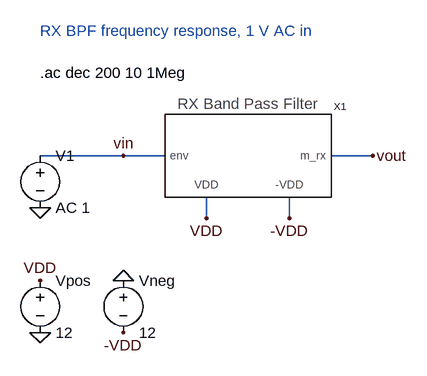
[diagram p0: schematic RX_BPF_AC.asc]
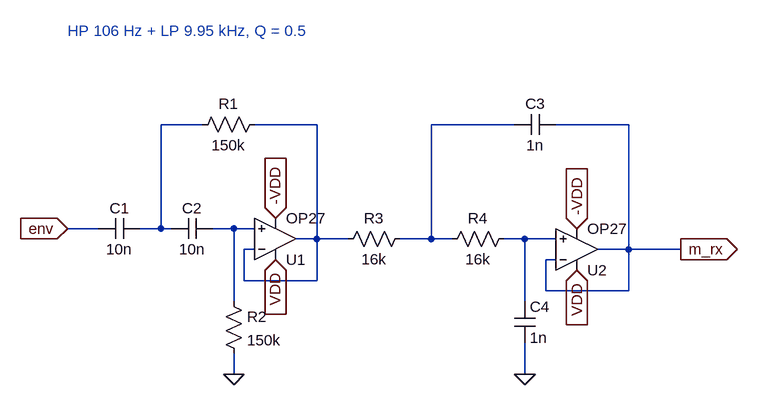
[diagram p1: sub-circuit band_pass_filter_rx.asc]
RX_BPF_AC.asc, the LTspice schematic file:
Version 4.1
SHEET 1 1200 680
WIRE -320 0 -192 0
WIRE -192 0 -128 0
WIRE 128 0 192 0
WIRE -64 64 -64 96
WIRE 64 64 64 96
FLAG -192 0 vin
FLAG 192 0 vout
FLAG -64 96 VDD
FLAG 64 96 -VDD
FLAG -320 80 0
FLAG -320 192 VDD
FLAG -320 272 0
FLAG -192 192 0
FLAG -192 272 -VDD
SYMBOL Band_Pass_Filter_RX 0 0 R0
SYMATTR InstName X1
SYMBOL voltage -320 -16 R0
WINDOW 123 0 0 Left 0
WINDOW 39 0 0 Left 0
SYMATTR InstName V1
SYMATTR Value AC 1
SYMBOL voltage -320 176 R0
WINDOW 123 0 0 Left 0
WINDOW 39 0 0 Left 0
SYMATTR InstName Vpos
SYMATTR Value 12
SYMBOL voltage -192 176 R0
WINDOW 123 0 0 Left 0
WINDOW 39 0 0 Left 0
SYMATTR InstName Vneg
SYMATTR Value 12
TEXT -320 -192 Left 2 ;RX BPF frequency response, 1 V AC in
TEXT -320 -128 Left 2 !.ac dec 200 10 1Meg

band_pass_filter_rx.asc, the sub-circuit schematic file:
Version 4.1
SHEET 1 1048 680
WIRE 112 -48 48 -48
WIRE 288 -48 192 -48
WIRE 592 -48 464 -48
WIRE 768 -48 656 -48
WIRE -48 112 -96 112
WIRE 48 112 48 -48
WIRE 48 112 16 112
WIRE 64 112 48 112
WIRE 160 112 128 112
WIRE 192 112 160 112
WIRE 288 128 288 -48
WIRE 288 128 256 128
WIRE 336 128 288 128
WIRE 464 128 464 -48
WIRE 464 128 416 128
WIRE 496 128 464 128
WIRE 608 128 576 128
WIRE 656 128 608 128
WIRE 192 144 176 144
WIRE 768 144 768 -48
WIRE 768 144 720 144
WIRE 848 144 768 144
WIRE 656 160 640 160
WIRE 176 192 176 144
WIRE 288 192 288 128
WIRE 288 192 176 192
WIRE 640 208 640 160
WIRE 768 208 768 144
WIRE 768 208 640 208
WIRE 160 224 160 112
WIRE 608 224 608 128
WIRE 160 336 160 304
WIRE 608 336 608 288
FLAG 608 336 0
FLAG 160 336 0
FLAG 224 160 VDD
IOPIN 224 160 In
FLAG 688 112 -VDD
IOPIN 688 112 In
FLAG 224 96 -VDD
IOPIN 224 96 In
FLAG 688 176 VDD
IOPIN 688 176 In
FLAG 848 144 m_rx
IOPIN 848 144 Out
FLAG -96 112 env
IOPIN -96 112 In
SYMBOL OpAmps\\OP27 224 192 M180
SYMATTR InstName U1
SYMBOL OpAmps\\OP27 688 208 M180
SYMATTR InstName U2
SYMBOL cap 16 96 R90
WINDOW 0 0 32 VBottom 2
WINDOW 3 32 32 VTop 2
SYMATTR InstName C1
SYMATTR Value 10n
SYMBOL cap 128 96 R90
WINDOW 0 0 32 VBottom 2
WINDOW 3 32 32 VTop 2
SYMATTR InstName C2
SYMATTR Value 10n
SYMBOL res 208 -64 R90
WINDOW 0 0 56 VBottom 2
WINDOW 3 32 56 VTop 2
SYMATTR InstName R1
SYMATTR Value 150k
SYMBOL res 144 208 R0
SYMATTR InstName R2
SYMATTR Value 150k
SYMBOL res 432 112 R90
WINDOW 0 0 56 VBottom 2
WINDOW 3 32 56 VTop 2
SYMATTR InstName R3
SYMATTR Value 16k
SYMBOL res 592 112 R90
WINDOW 0 0 56 VBottom 2
WINDOW 3 32 56 VTop 2
SYMATTR InstName R4
SYMATTR Value 16k
SYMBOL cap 656 -64 R90
WINDOW 0 0 32 VBottom 2
WINDOW 3 32 32 VTop 2
SYMATTR InstName C3
SYMATTR Value 1n
SYMBOL cap 592 224 R0
SYMATTR InstName C4
SYMATTR Value 1n
TEXT -96 -192 Left 2 ;HP 106 Hz + LP 9.95 kHz, Q = 0.5

The netlist it stands for:
* RX_BPF_AC.asc
X§X1 vin vout VDD -VDD band_pass_filter_rx
V1 vin 0 AC 1
Vpos VDD 0 12
Vneg 0 -VDD 12

* block symbol definitions
.subckt band_pass_filter_rx env m_rx VDD -VDD
X§U1 N004 N002 VDD -VDD N002 OP27  ; pins In+ In- V+ V- OUT
X§U2 N005 m_rx VDD -VDD m_rx OP27  ; pins In+ In- V+ V- OUT
C1 N001 env 10n
C2 N004 N001 10n
R1 N002 N001 150k
R2 N004 0 150k
R3 N003 N002 16k
R4 N005 N003 16k
C3 m_rx N003 1n
C4 N005 0 1n
* HP 106 Hz + LP 9.95 kHz, Q = 0.5
.ends band_pass_filter_rx

* RX BPF frequency response, 1 V AC in
.ac dec 200 10 1Meg
.lib ADI.lib
.backanno
.end